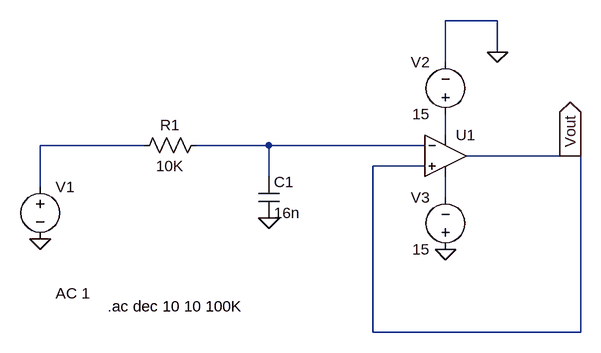
[diagram p0: schematic first_order_lowpass.asc]
first_order_lowpass.asc, the LTspice schematic file:
Version 4.1
SHEET 1 916 680
WIRE 720 -112 640 -112
WIRE 720 -64 720 -112
WIRE 640 -48 640 -112
WIRE 640 64 640 32
WIRE 176 80 16 80
WIRE 368 80 256 80
WIRE 608 80 368 80
WIRE 832 96 672 96
WIRE 848 96 832 96
WIRE 608 112 528 112
WIRE 368 128 368 80
WIRE 16 144 16 80
WIRE 640 160 640 128
WIRE 528 368 528 112
WIRE 848 368 848 96
WIRE 848 368 528 368
FLAG 16 224 0
FLAG 368 192 0
FLAG 720 -64 0
FLAG 640 240 0
FLAG 832 96 Vout
IOPIN 832 96 Out
SYMBOL voltage 16 128 R0
WINDOW 3 24 152 Left 2
WINDOW 123 24 180 Left 2
WINDOW 39 0 0 Left 0
SYMATTR InstName V1
SYMATTR Value ""
SYMATTR Value2 AC 1
SYMBOL res 272 64 R90
WINDOW 0 0 56 VBottom 2
WINDOW 3 32 56 VTop 2
SYMATTR InstName R1
SYMATTR Value 10K
SYMBOL cap 352 128 R0
SYMATTR InstName C1
SYMATTR Value 16n
SYMBOL OpAmps\\UniversalOpAmp2 640 96 R0
SYMATTR InstName U1
SYMBOL voltage 640 48 R180
WINDOW 0 24 96 Left 2
WINDOW 3 24 16 Left 2
WINDOW 123 0 0 Left 0
WINDOW 39 0 0 Left 0
SYMATTR InstName V2
SYMATTR Value 15
SYMBOL voltage 640 256 R180
WINDOW 0 24 96 Left 2
WINDOW 3 24 16 Left 2
WINDOW 123 0 0 Left 0
WINDOW 39 0 0 Left 0
SYMATTR InstName V3
SYMATTR Value 15
TEXT 120 328 Left 2 !.ac dec 10 10 100K

The netlist it stands for:
* first_order_lowpass.asc
V1 N002 0 AC 1
R1 N003 N002 10K
C1 N003 0 16n
X§U1 Vout N003 N001 N004 Vout level2 Avol=1Meg GBW=10Meg Slew=10Meg Ilimit=25m Rail=0 Vos=0 En=0 Enk=0 In=0 Ink=0 Rin=500Meg  ; pins In+ In- V+ V- OUT
V2 N001 0 15
V3 0 N004 15
.ac dec 10 10 100K
.lib UniversalOpAmp2.lib
.backanno
.end